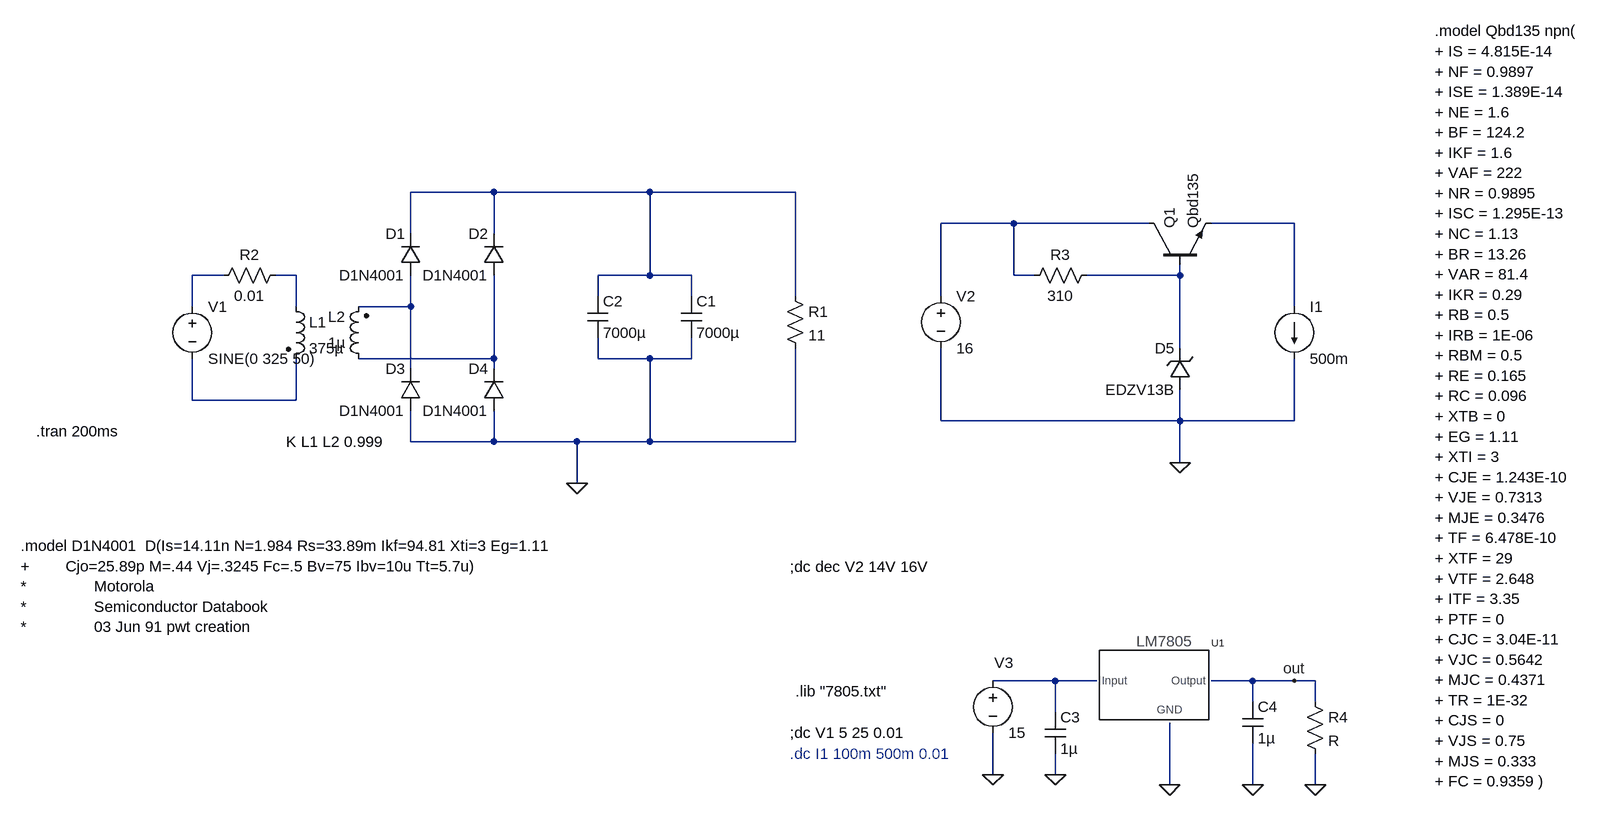
[diagram p0: schematic Project.asc]
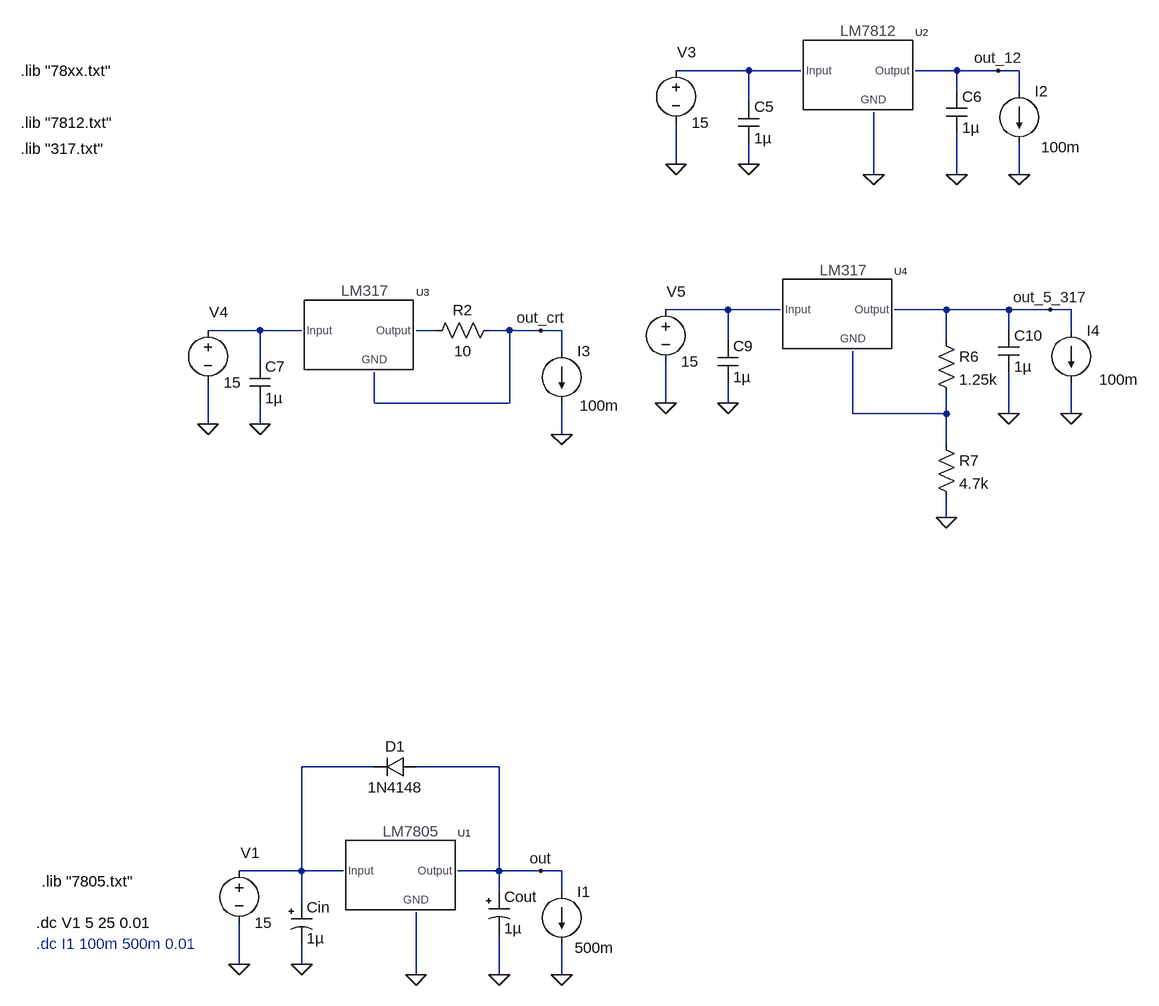
[diagram p1: sub-circuit lm7805.asc]
Project.asc, the LTspice schematic file:
Version 4
SHEET 1 2024 1156
WIRE 336 -48 208 -48
WIRE 576 -48 336 -48
WIRE 800 -48 576 -48
WIRE 1136 0 1024 0
WIRE 1344 0 1136 0
WIRE 1568 0 1440 0
WIRE 208 16 208 -48
WIRE 336 16 336 -48
WIRE -80 80 -128 80
WIRE 32 80 0 80
WIRE 576 80 576 -48
WIRE 576 80 496 80
WIRE 640 80 576 80
WIRE 1136 80 1136 0
WIRE 1168 80 1136 80
WIRE 1392 80 1392 64
WIRE 1392 80 1248 80
WIRE 496 112 496 80
WIRE 640 112 640 80
WIRE 800 112 800 -48
WIRE 1024 112 1024 0
WIRE -128 128 -128 80
WIRE 32 128 32 80
WIRE 208 128 208 80
WIRE 208 128 128 128
WIRE 1568 128 1568 0
WIRE 1392 192 1392 80
WIRE 336 208 336 80
WIRE 336 208 128 208
WIRE 496 208 496 176
WIRE 576 208 496 208
WIRE 640 208 640 176
WIRE 640 208 576 208
WIRE 208 224 208 128
WIRE 336 224 336 208
WIRE -128 272 -128 208
WIRE 32 272 32 208
WIRE 32 272 -128 272
WIRE 1024 304 1024 192
WIRE 1392 304 1392 256
WIRE 1392 304 1024 304
WIRE 1568 304 1568 208
WIRE 1568 304 1392 304
WIRE 208 336 208 288
WIRE 336 336 336 288
WIRE 336 336 208 336
WIRE 464 336 336 336
WIRE 576 336 576 208
WIRE 576 336 464 336
WIRE 800 336 800 192
WIRE 800 336 576 336
WIRE 1392 368 1392 304
WIRE 464 400 464 336
WIRE 1200 704 1104 704
WIRE 1264 704 1200 704
WIRE 1504 704 1440 704
WIRE 1568 704 1504 704
WIRE 1600 704 1568 704
WIRE 1504 736 1504 704
WIRE 1600 736 1600 704
WIRE 1200 752 1200 704
WIRE 1104 848 1104 784
WIRE 1200 848 1200 816
WIRE 1376 864 1376 768
WIRE 1504 864 1504 800
WIRE 1600 864 1600 816
FLAG 464 400 0
FLAG 1392 368 0
FLAG 1376 864 0
FLAG 1600 864 0
FLAG 1104 848 0
FLAG 1200 848 0
FLAG 1504 864 0
FLAG 1568 704 out
SYMBOL ind2 16 112 R0
SYMATTR InstName L1
SYMATTR Value 375µ
SYMATTR Type ind
SYMBOL ind2 144 224 R180
WINDOW 0 36 80 Left 2
WINDOW 3 36 40 Left 2
SYMATTR InstName L2
SYMATTR Value 1µ
SYMATTR Type ind
SYMBOL voltage -128 112 R0
WINDOW 123 24 124 Left 2
WINDOW 39 24 152 Left 2
SYMATTR InstName V1
SYMATTR Value SINE(0 325 50)
SYMBOL cap 624 112 R0
SYMATTR InstName C1
SYMATTR Value 7000µ
SYMBOL res 784 96 R0
SYMATTR InstName R1
SYMATTR Value 11
SYMBOL cap 480 112 R0
SYMATTR InstName C2
SYMATTR Value 7000µ
SYMBOL diode 224 80 R180
WINDOW 0 24 64 Left 2
WINDOW 3 24 0 Left 2
SYMATTR InstName D1
SYMATTR Value D1N4001
SYMBOL diode 352 80 R180
WINDOW 0 24 64 Left 2
WINDOW 3 24 0 Left 2
SYMATTR InstName D2
SYMATTR Value D1N4001
SYMBOL diode 224 288 R180
WINDOW 0 24 64 Left 2
WINDOW 3 24 0 Left 2
SYMATTR InstName D3
SYMATTR Value D1N4001
SYMBOL diode 352 288 R180
WINDOW 0 24 64 Left 2
WINDOW 3 24 0 Left 2
SYMATTR InstName D4
SYMATTR Value D1N4001
SYMBOL res -96 96 R270
WINDOW 0 32 56 VTop 2
WINDOW 3 0 56 VBottom 2
SYMATTR InstName R2
SYMATTR Value 0.01
SYMBOL voltage 1024 96 R0
WINDOW 123 0 0 Left 0
WINDOW 39 0 0 Left 0
SYMATTR InstName V2
SYMATTR Value 16
SYMBOL res 1152 96 R270
WINDOW 0 32 56 VTop 2
WINDOW 3 0 56 VBottom 2
SYMATTR InstName R3
SYMATTR Value 310
SYMBOL zener 1408 256 R180
WINDOW 0 24 64 Left 2
WINDOW 3 24 0 Left 2
SYMATTR InstName D5
SYMATTR Value EDZV13B
SYMATTR Description Diode
SYMATTR Type diode
SYMBOL npn 1344 64 R270
SYMATTR InstName Q1
SYMATTR Value Qbd135
SYMBOL current 1568 128 R0
WINDOW 123 0 0 Left 0
WINDOW 39 0 0 Left 0
SYMATTR InstName I1
SYMATTR Value 500m
SYMBOL voltage 1104 688 R0
WINDOW 123 0 0 Left 2
WINDOW 39 0 0 Left 2
WINDOW 0 2 -12 Left 2
SYMATTR InstName V3
SYMATTR Value 15
SYMBOL LM7805 1344 672 R0
SYMATTR InstName U1
SYMATTR Prefix X
SYMATTR Value LM7805C
SYMBOL cap 1184 752 R0
SYMATTR InstName C3
SYMATTR Value 1µ
SYMBOL cap 1488 736 R0
SYMATTR InstName C4
SYMATTR Value 1µ
SYMBOL res 1584 720 R0
SYMATTR InstName R4
TEXT 16 336 Left 2 !K L1 L2 0.999
TEXT -368 320 Left 2 !.tran 200ms
TEXT -392 496 Left 2 !.model D1N4001  D(Is=14.11n N=1.984 Rs=33.89m Ikf=94.81 Xti=3 Eg=1.11 \n+        Cjo=25.89p M=.44 Vj=.3245 Fc=.5 Bv=75 Ibv=10u Tt=5.7u)      \n*               Motorola \n*               Semiconductor Databook  \n*               03 Jun 91 pwt creation
TEXT 1784 -296 Left 2 !.model Qbd135 npn(\n+ IS = 4.815E-14\n+ NF = 0.9897\n+ ISE = 1.389E-14\n+ NE = 1.6\n+ BF = 124.2\n+ IKF = 1.6\n+ VAF = 222\n+ NR = 0.9895\n+ ISC = 1.295E-13\n+ NC = 1.13\n+ BR = 13.26\n+ VAR = 81.4\n+ IKR = 0.29\n+ RB = 0.5\n+ IRB = 1E-06\n+ RBM = 0.5\n+ RE = 0.165\n+ RC = 0.096\n+ XTB = 0\n+ EG = 1.11\n+ XTI = 3\n+ CJE = 1.243E-10\n+ VJE = 0.7313\n+ MJE = 0.3476\n+ TF = 6.478E-10\n+ XTF = 29\n+ VTF = 2.648\n+ ITF = 3.35\n+ PTF = 0\n+ CJC = 3.04E-11\n+ VJC = 0.5642\n+ MJC = 0.4371\n+ TR = 1E-32\n+ CJS = 0\n+ VJS = 0.75\n+ MJS = 0.333\n+ FC = 0.9359 )
TEXT 792 528 Left 2 !;dc dec V2 14V 16V
TEXT 792 784 Left 2 !;dc V1 5 25 0.01
TEXT 800 720 Left 2 !.lib "7805.txt"
TEXT 792 816 Left 2 ;.dc I1 100m 500m 0.01

lm7805.asc, the sub-circuit schematic file:
Version 4
SHEET 1 1928 3252
WIRE 992 96 880 96
WIRE 1072 96 992 96
WIRE 1312 96 1248 96
WIRE 1376 96 1312 96
WIRE 1408 96 1376 96
WIRE 1312 128 1312 96
WIRE 1408 128 1408 96
WIRE 992 144 992 96
WIRE 880 240 880 176
WIRE 992 240 992 208
WIRE 1184 256 1184 160
WIRE 1312 256 1312 192
WIRE 1408 256 1408 208
WIRE 960 464 864 464
WIRE 1040 464 960 464
WIRE 1296 464 1216 464
WIRE 1392 464 1296 464
WIRE 1456 464 1392 464
WIRE 1488 464 1456 464
WIRE 240 496 160 496
WIRE 304 496 240 496
WIRE 512 496 480 496
WIRE 624 496 592 496
WIRE 672 496 624 496
WIRE 704 496 672 496
WIRE 1392 496 1392 464
WIRE 1488 496 1488 464
WIRE 960 512 960 464
WIRE 1296 512 1296 464
WIRE 704 528 704 496
WIRE 240 544 240 496
WIRE 416 608 416 560
WIRE 624 608 624 496
WIRE 624 608 416 608
WIRE 864 608 864 544
WIRE 960 608 960 576
WIRE 1152 624 1152 528
WIRE 1296 624 1296 592
WIRE 1296 624 1152 624
WIRE 1392 624 1392 560
WIRE 1488 624 1488 576
WIRE 160 640 160 576
WIRE 240 640 240 608
WIRE 704 656 704 608
WIRE 1296 672 1296 624
WIRE 1296 784 1296 752
WIRE 416 1168 304 1168
WIRE 608 1168 480 1168
WIRE 304 1328 304 1168
WIRE 304 1328 208 1328
WIRE 368 1328 304 1328
WIRE 608 1328 608 1168
WIRE 608 1328 544 1328
WIRE 672 1328 608 1328
WIRE 704 1328 672 1328
WIRE 608 1360 608 1328
WIRE 704 1360 704 1328
WIRE 304 1376 304 1328
WIRE 208 1472 208 1408
WIRE 304 1472 304 1440
WIRE 480 1488 480 1392
WIRE 608 1488 608 1424
WIRE 704 1488 704 1440
FLAG 480 1488 0
FLAG 704 1488 0
FLAG 208 1472 0
FLAG 304 1472 0
FLAG 608 1488 0
FLAG 672 1328 out
FLAG 1184 256 0
FLAG 1408 256 0
FLAG 880 240 0
FLAG 992 240 0
FLAG 1312 256 0
FLAG 1376 96 out_12
FLAG 704 656 0
FLAG 160 640 0
FLAG 240 640 0
FLAG 672 496 out_crt
FLAG 1296 784 0
FLAG 1488 624 0
FLAG 864 608 0
FLAG 960 608 0
FLAG 1392 624 0
FLAG 1456 464 out_5_317
SYMBOL polcap 592 1360 R0
WINDOW 3 24 56 Left 2
SYMATTR Value 1µ
SYMATTR InstName Cout
SYMATTR Description Capacitor
SYMATTR Type cap
SYMATTR SpiceLine V=50 Irms=55m Rser=2.53014 Lser=1.66206n mfg="Würth Elektronik" pn="865080640001 WCAP-ASLI 4x5,5" type="Al electrolytic"
SYMBOL voltage 208 1312 R0
WINDOW 123 0 0 Left 2
WINDOW 39 0 0 Left 2
WINDOW 0 2 -12 Left 2
SYMATTR InstName V1
SYMATTR Value 15
SYMBOL LM7805 448 1296 R0
SYMATTR InstName U1
SYMATTR Prefix X
SYMATTR Value LM7805C
SYMBOL cap 976 144 R0
SYMATTR InstName C5
SYMATTR Value 1µ
SYMBOL cap 1296 128 R0
SYMATTR InstName C6
SYMATTR Value 1µ
SYMBOL voltage 880 80 R0
WINDOW 123 0 0 Left 2
WINDOW 39 0 0 Left 2
WINDOW 0 2 -12 Left 2
SYMATTR InstName V3
SYMATTR Value 15
SYMBOL cap 224 544 R0
SYMATTR InstName C7
SYMATTR Value 1µ
SYMBOL voltage 160 480 R0
WINDOW 123 0 0 Left 2
WINDOW 39 0 0 Left 2
WINDOW 0 2 -12 Left 2
SYMATTR InstName V4
SYMATTR Value 15
SYMBOL cap 944 512 R0
SYMATTR InstName C9
SYMATTR Value 1µ
SYMBOL cap 1376 496 R0
SYMATTR InstName C10
SYMATTR Value 1µ
SYMBOL voltage 864 448 R0
WINDOW 123 0 0 Left 2
WINDOW 39 0 0 Left 2
WINDOW 0 2 -12 Left 2
SYMATTR InstName V5
SYMATTR Value 15
SYMBOL LM317 384 464 R0
SYMATTR InstName U3
SYMATTR Prefix X
SYMATTR Value LM317
SYMBOL LM7812 1152 64 R0
SYMATTR InstName U2
SYMATTR Prefix X
SYMATTR Value LM7812C
SYMBOL res 608 480 R90
WINDOW 0 0 56 VBottom 2
WINDOW 3 32 56 VTop 2
SYMATTR InstName R2
SYMATTR Value 10
SYMBOL res 1280 496 R0
SYMATTR InstName R6
SYMATTR Value 1.25k
SYMBOL res 1280 656 R0
SYMATTR InstName R7
SYMATTR Value 4.7k
SYMBOL LM317 1120 432 R0
SYMATTR InstName U4
SYMATTR Prefix X
SYMATTR Value LM317
SYMBOL current 704 1360 R0
WINDOW 123 0 0 Left 0
WINDOW 39 0 0 Left 0
WINDOW 3 20 86 Left 2
SYMATTR Value 500m
SYMATTR InstName I1
SYMBOL current 1408 128 R0
WINDOW 3 34 86 Left 2
SYMATTR Value 100m
SYMATTR InstName I2
SYMBOL current 704 528 R0
WINDOW 3 28 84 Left 2
SYMATTR Value 100m
SYMATTR InstName I3
SYMBOL current 1488 496 R0
WINDOW 3 43 76 Left 2
WINDOW 123 0 0 Left 0
WINDOW 39 0 0 Left 0
SYMATTR Value 100m
SYMATTR InstName I4
SYMBOL diode 480 1152 R90
WINDOW 0 0 32 VBottom 2
WINDOW 3 32 32 VTop 2
SYMATTR InstName D1
SYMATTR Value 1N4148
SYMBOL polcap 288 1376 R0
SYMATTR InstName Cin
SYMATTR Value 1µ
TEXT -104 1408 Left 2 !.dc V1 5 25 0.01
TEXT -96 1344 Left 2 !.lib "7805.txt"
TEXT -128 96 Left 2 !.lib "78xx.txt"
TEXT -128 176 Left 2 !.lib "7812.txt"
TEXT -128 216 Left 2 !.lib "317.txt"
TEXT -104 1440 Left 2 ;.dc I1 100m 500m 0.01

The netlist it stands for:
* Project.asc
L1 N005 N009 375µ
L2 N008 N007 1µ
V1 N004 N009 SINE(0 325 50)
C1 N001 0 7000µ
R1 N001 0 11
C2 N001 0 7000µ
D1 N007 N001 D1N4001
D2 N008 N001 D1N4001
D3 0 N007 D1N4001
D4 0 N008 D1N4001
R2 N004 N005 0.01
V2 N002 0 16
R3 N002 N006 310
D5 0 N006 EDZV13B
Q1 N002 N006 N003 0 Qbd135
I1 N003 0 500m
V3 N010 0 15
XU1 N010 0 out lm7805 params: LM7805C
C3 N010 0 1µ
C4 out 0 1µ
R4 out 0 R

* block symbol definitions
.subckt lm7805 Input GND Output
Cout out 0 1µ V=50 Irms=55m Rser=2.53014 Lser=1.66206n mfg="Würth Elektronik" pn="865080640001 WCAP-ASLI 4x5,5" type="Al electrolytic"
V1 N006 0 15
XU1 N006 0 out lm7805 params: LM7805C
C5 N001 0 1µ
C6 out_12 0 1µ
V3 N001 0 15
C7 N003 0 1µ
V4 N003 0 15
C9 N002 0 1µ
C10 out_5_317 0 1µ
V5 N002 0 15
XU3 N003 out_crt N004 LM317 params: LM317  ; pins Input GND Output
XU2 N001 0 out_12 LM7812 params: LM7812C  ; pins Input GND Output
R2 out_crt N004 10
R6 out_5_317 N005 1.25k
R7 N005 0 4.7k
XU4 N002 N005 out_5_317 LM317 params: LM317  ; pins Input GND Output
I1 out 0 500m
I2 out_12 0 100m
I3 out_crt 0 100m
I4 out_5_317 0 100m
D1 out N006 1N4148
Cin N006 0 1µ
.dc V1 5 25 0.01
.lib "7805.txt"
.lib "78xx.txt"
.lib "7812.txt"
.lib "317.txt"
* .dc I1 100m 500m 0.01
.ends lm7805

.model D D
.lib standard.dio
.model NPN NPN
.model PNP PNP
.lib standard.bjt
K L1 L2 0.999
.tran 200ms
.model D1N4001  D(Is=14.11n N=1.984 Rs=33.89m Ikf=94.81 Xti=3 Eg=1.11
+        Cjo=25.89p M=.44 Vj=.3245 Fc=.5 Bv=75 Ibv=10u Tt=5.7u)
*               Motorola
*               Semiconductor Databook
*               03 Jun 91 pwt creation
.model Qbd135 npn(
+ IS = 4.815E-14
+ NF = 0.9897
+ ISE = 1.389E-14
+ NE = 1.6
+ BF = 124.2
+ IKF = 1.6
+ VAF = 222
+ NR = 0.9895
+ ISC = 1.295E-13
+ NC = 1.13
+ BR = 13.26
+ VAR = 81.4
+ IKR = 0.29
+ RB = 0.5
+ IRB = 1E-06
+ RBM = 0.5
+ RE = 0.165
+ RC = 0.096
+ XTB = 0
+ EG = 1.11
+ XTI = 3
+ CJE = 1.243E-10
+ VJE = 0.7313
+ MJE = 0.3476
+ TF = 6.478E-10
+ XTF = 29
+ VTF = 2.648
+ ITF = 3.35
+ PTF = 0
+ CJC = 3.04E-11
+ VJC = 0.5642
+ MJC = 0.4371
+ TR = 1E-32
+ CJS = 0
+ VJS = 0.75
+ MJS = 0.333
+ FC = 0.9359 )
;dc dec V2 14V 16V
;dc V1 5 25 0.01
.lib "7805.txt"
* .dc I1 100m 500m 0.01
.backanno
.end